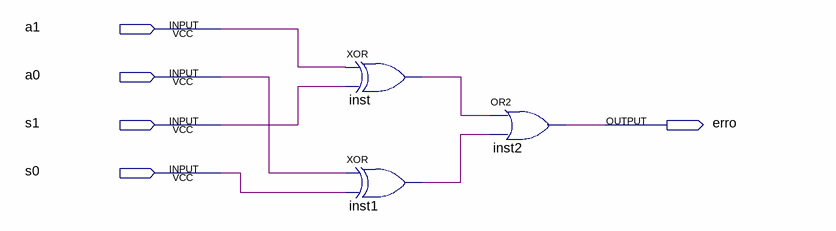
[diagram p0: schematic sheet]
// Quartus schematic comparador.bdf as structural Verilog: 3 symbols, 5 pins
module comparador (
  input  a1,
  input  a0,
  input  s1,
  input  s0,
  output erro
);

  wire inst1_out, inst_out;

  xor inst (inst_out, a1, s1);
  xor inst1 (inst1_out, a0, s0);
  or inst2 (erro, inst_out, inst1_out);
endmodule
